# Altium schematic sheet Top_Sheet.SchDoc
size A; SheetNumber: 1; SheetTotal: 3
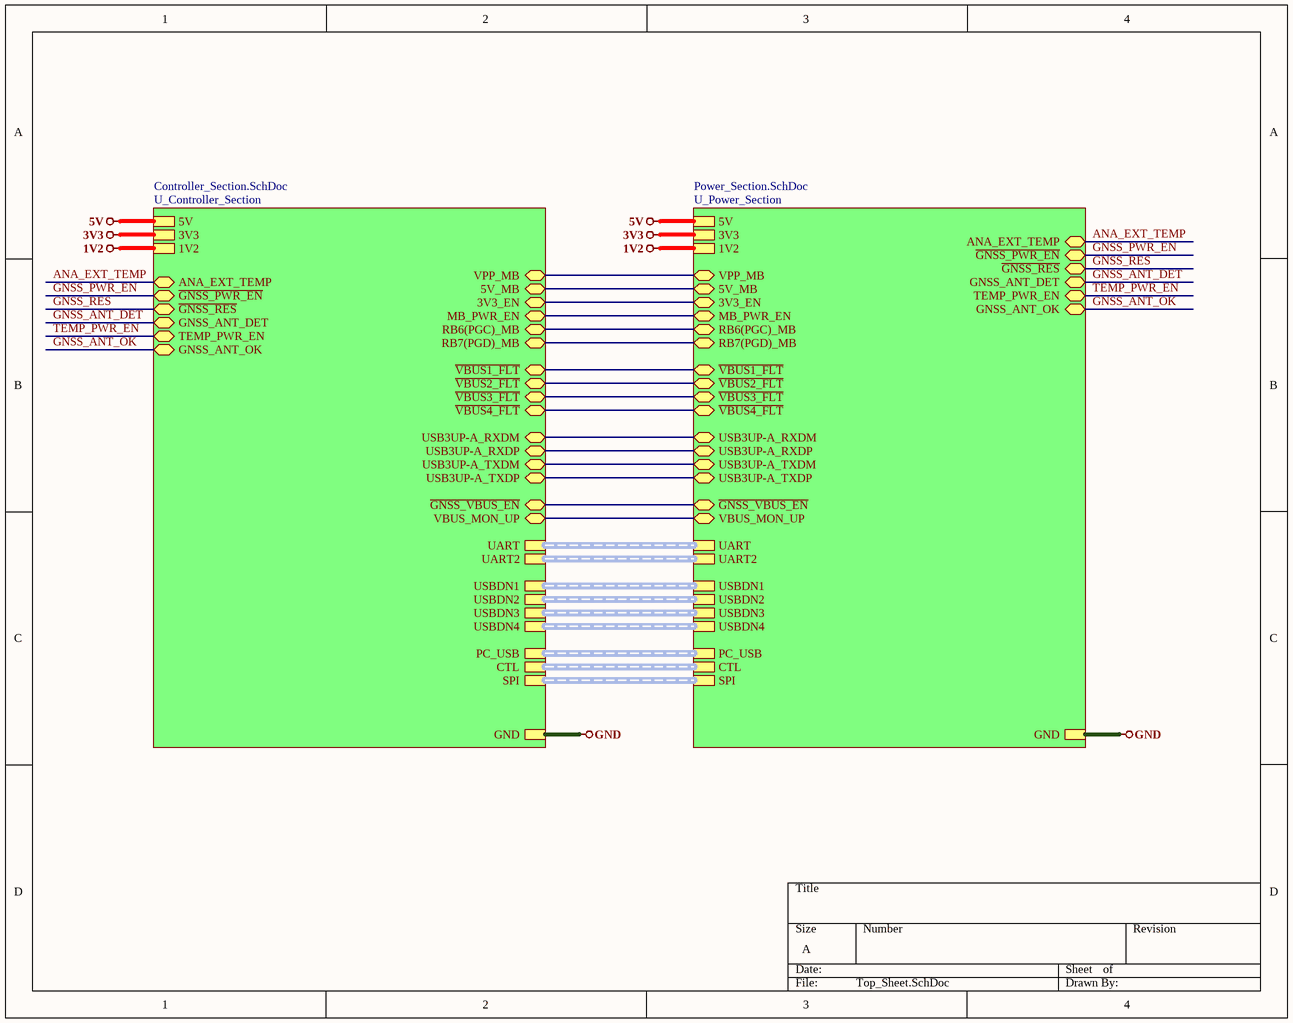
[diagram p0: Top_Sheet.SchDoc]

## Sub-sheets
U_Controller_Section = Controller_Section.SchDoc: RB6(PGC)_MB (bidir), RB7(PGD)_MB (bidir), VPP_MB (bidir), 5V_MB (bidir), 3V3_EN (bidir), MB_PWR_EN (bidir), USB3UP-A_RXDM (bidir), USB3UP-A_RXDP (bidir), USB3UP-A_TXDM (bidir), USB3UP-A_TXDP (bidir), UART (harness UART1), USBDN1 (harness USBDN1), USBDN2 (harness USBDN2), USBDN3 (harness USBDN3), USBDN4 (harness USBDN4), UART2 (harness UART2), PC_USB (harness PC_USB), ~{VBUS1_FLT} (bidir), ~{VBUS2_FLT} (bidir), ~{VBUS3_FLT} (bidir), ~{VBUS4_FLT} (bidir), CTL (harness CTL), ~{GNSS_VBUS_EN} (bidir), SPI (harness SPI), VBUS_MON_UP (bidir), GND, 1V2, 3V3, 5V, ANA_EXT_TEMP (bidir), ~{GNSS_PWR_EN} (bidir), ~{GNSS_RES} (bidir), GNSS_ANT_DET (bidir), TEMP_PWR_EN (bidir), GNSS_ANT_OK (bidir)
U_Power_Section = Power_Section.SchDoc: GND, 1V2, 3V3, 5V, CTL (harness CTL), SPI (harness SPI), 3V3_EN (bidir), MB_PWR_EN (bidir), UART (harness UART1), RB6(PGC)_MB (bidir), RB7(PGD)_MB (bidir), VPP_MB (bidir), 5V_MB (bidir), USBDN1 (harness USBDN1), USBDN2 (harness USBDN2), USBDN3 (harness USBDN3), USBDN4 (harness USBDN4), ~{VBUS1_FLT} (bidir), UART2 (harness UART2), PC_USB (harness PC_USB), USB3UP-A_RXDM (bidir), USB3UP-A_RXDP (bidir), USB3UP-A_TXDM (bidir), USB3UP-A_TXDP (bidir), ~{VBUS2_FLT} (bidir), ~{VBUS3_FLT} (bidir), ~{GNSS_VBUS_EN} (bidir), VBUS_MON_UP (bidir), ~{VBUS4_FLT} (bidir), ANA_EXT_TEMP (bidir), ~{GNSS_PWR_EN} (bidir), ~{GNSS_RES} (bidir), GNSS_ANT_DET (bidir), TEMP_PWR_EN (bidir), GNSS_ANT_OK (bidir)

## Nets
1V2: sheet U_Controller_Section/1V2, sheet U_Power_Section/1V2
3V3: sheet U_Controller_Section/3V3, sheet U_Power_Section/3V3
5V: sheet U_Controller_Section/5V, sheet U_Power_Section/5V
GND: sheet U_Controller_Section/GND, sheet U_Power_Section/GND
ANA_EXT_TEMP: sheet U_Controller_Section/ANA_EXT_TEMP, sheet U_Power_Section/ANA_EXT_TEMP
~{GNSS_PWR_EN}: sheet U_Controller_Section/~{GNSS_PWR_EN}, sheet U_Power_Section/~{GNSS_PWR_EN}
~{GNSS_RES}: sheet U_Controller_Section/~{GNSS_RES}, sheet U_Power_Section/~{GNSS_RES}
GNSS_ANT_DET: sheet U_Controller_Section/GNSS_ANT_DET, sheet U_Power_Section/GNSS_ANT_DET
GNSS_ANT_OK: sheet U_Controller_Section/GNSS_ANT_OK, sheet U_Power_Section/GNSS_ANT_OK
TEMP_PWR_EN: sheet U_Controller_Section/TEMP_PWR_EN, sheet U_Power_Section/TEMP_PWR_EN
(unnamed): sheet U_Controller_Section/RB6(PGC)_MB, sheet U_Power_Section/RB6(PGC)_MB
(unnamed): sheet U_Controller_Section/RB7(PGD)_MB, sheet U_Power_Section/RB7(PGD)_MB
(unnamed): sheet U_Controller_Section/VPP_MB, sheet U_Power_Section/VPP_MB
(unnamed): sheet U_Controller_Section/5V_MB, sheet U_Power_Section/5V_MB
(unnamed): sheet U_Controller_Section/3V3_EN, sheet U_Power_Section/3V3_EN
(unnamed): sheet U_Controller_Section/MB_PWR_EN, sheet U_Power_Section/MB_PWR_EN
(unnamed): sheet U_Controller_Section/USB3UP-A_RXDM, sheet U_Power_Section/USB3UP-A_RXDM
(unnamed): sheet U_Controller_Section/USB3UP-A_RXDP, sheet U_Power_Section/USB3UP-A_RXDP
(unnamed): sheet U_Controller_Section/USB3UP-A_TXDM, sheet U_Power_Section/USB3UP-A_TXDM
(unnamed): sheet U_Controller_Section/USB3UP-A_TXDP, sheet U_Power_Section/USB3UP-A_TXDP
(unnamed): sheet U_Controller_Section/~{VBUS1_FLT}, sheet U_Power_Section/~{VBUS1_FLT}
(unnamed): sheet U_Controller_Section/~{VBUS2_FLT}, sheet U_Power_Section/~{VBUS2_FLT}
(unnamed): sheet U_Controller_Section/~{VBUS3_FLT}, sheet U_Power_Section/~{VBUS3_FLT}
(unnamed): sheet U_Controller_Section/~{VBUS4_FLT}, sheet U_Power_Section/~{VBUS4_FLT}
(unnamed): sheet U_Controller_Section/~{GNSS_VBUS_EN}, sheet U_Power_Section/~{GNSS_VBUS_EN}
(unnamed): sheet U_Controller_Section/VBUS_MON_UP, sheet U_Power_Section/VBUS_MON_UP

## Buses and harness runs
harness sheet U_Controller_Section/CTL = sheet U_Power_Section/CTL
harness sheet U_Controller_Section/PC_USB = sheet U_Power_Section/PC_USB
harness sheet U_Controller_Section/SPI = sheet U_Power_Section/SPI
harness sheet U_Controller_Section/UART2 = sheet U_Power_Section/UART2
harness sheet U_Controller_Section/UART = sheet U_Power_Section/UART
harness sheet U_Controller_Section/USBDN1 = sheet U_Power_Section/USBDN1
harness sheet U_Controller_Section/USBDN2 = sheet U_Power_Section/USBDN2
harness sheet U_Controller_Section/USBDN3 = sheet U_Power_Section/USBDN3
harness sheet U_Controller_Section/USBDN4 = sheet U_Power_Section/USBDN4